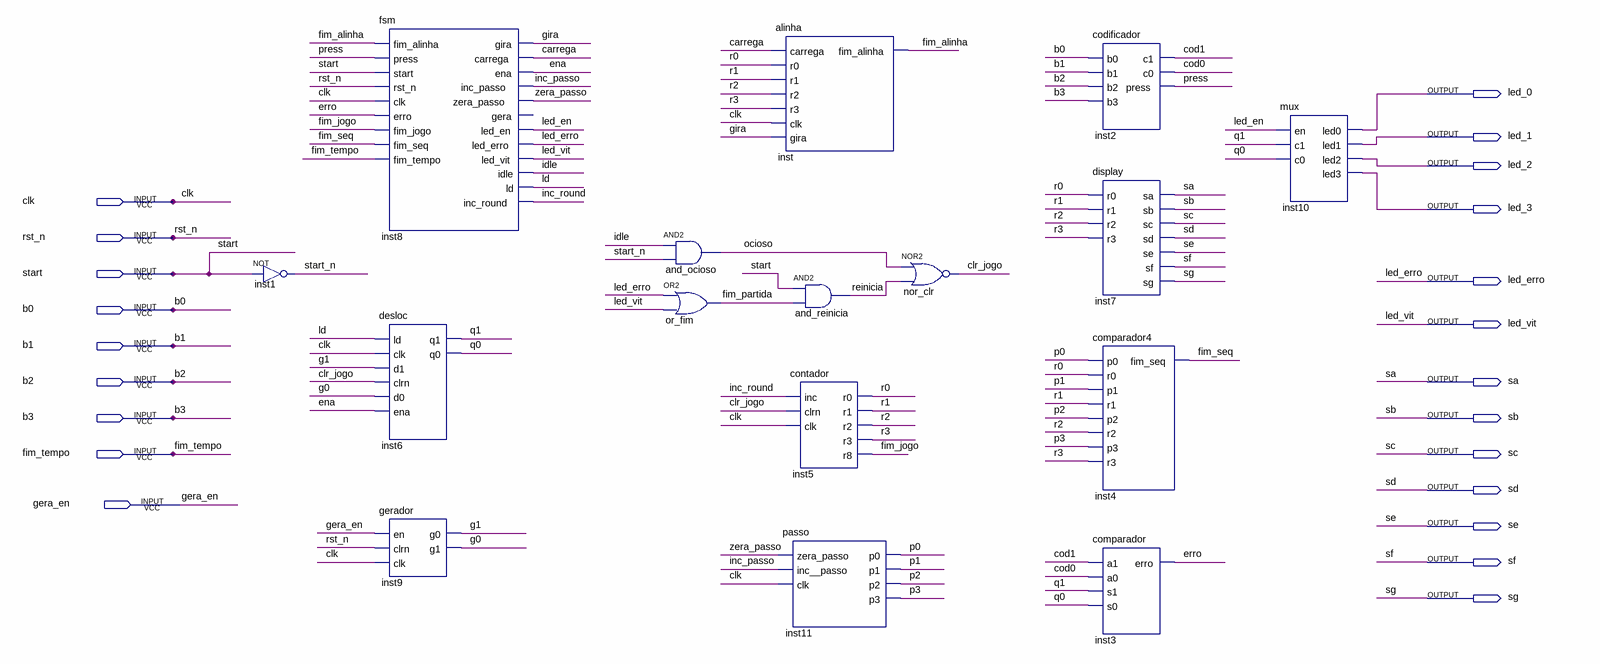
[diagram p0: schematic sheet]
// Quartus schematic genius.bdf as structural Verilog: 16 symbols, 22 pins
module genius (
  input  clk,
  input  rst_n,
  input  start,
  input  b0,
  input  b1,
  input  b2,
  input  b3,
  input  fim_tempo,
  input  gera_en,
  output led_0,
  output led_1,
  output led_2,
  output led_3,
  output led_erro,
  output led_vit,
  output sa,
  output sb,
  output sc,
  output sd,
  output se,
  output sf,
  output sg
);

  wire carrega, clr_jogo, cod0, cod1, ena, erro, fim_alinha, fim_jogo, fim_partida, fim_seq, g0, g1, gira,
       idle, inc_passo, inc_round, ld, led_en, ocioso, p0, p1, p2, p3, press, q0, q1, r0, r1, r2, r3,
       reinicia, start_n, zera_passo;

  not inst1 (start_n, start);
  fsm inst8 (
    .fim_alinha(fim_alinha), .press(press), .start(start), .rst_n(rst_n), .clk(clk), .erro(erro),
    .fim_jogo(fim_jogo), .fim_seq(fim_seq), .fim_tempo(fim_tempo), .gira(gira), .carrega(carrega), .ena(ena),
    .inc_passo(inc_passo), .zera_passo(zera_passo), .led_en(led_en), .led_erro(led_erro), .led_vit(led_vit),
    .idle(idle), .ld(ld), .inc_round(inc_round));  // open: gera
  desloc inst6 (.ld(ld), .clk(clk), .d1(g1), .clrn(clr_jogo), .d0(g0), .ena(ena), .q1(q1), .q0(q0));
  gerador inst9 (.en(gera_en), .clrn(rst_n), .clk(clk), .g0(g1), .g1(g0));
  and and_ocioso (ocioso, idle, start_n);
  or or_fim (fim_partida, led_erro, led_vit);
  alinha inst (.carrega(carrega), .r0(r0), .r1(r1), .r2(r2), .r3(r3), .clk(clk), .gira(gira), .fim_alinha(fim_alinha));
  and and_reinicia (reinicia, start, fim_partida);
  contador inst5 (.inc(inc_round), .clrn(clr_jogo), .clk(clk), .r0(r0), .r1(r1), .r2(r2), .r3(r3), .r8(fim_jogo));
  passo inst11 (.zera_passo(zera_passo), .inc__passo(inc_passo), .clk(clk), .p0(p0), .p1(p1), .p2(p2), .p3(p3));
  nor nor_clr (clr_jogo, ocioso, reinicia);
  codificador inst2 (.b0(b0), .b1(b1), .b2(b2), .b3(b3), .c1(cod1), .c0(cod0), .press(press));
  display inst7 (.r0(r0), .r1(r1), .r2(r2), .r3(r3), .sa(sa), .sb(sb), .sc(sc), .sd(sd), .se(se), .sf(sf), .sg(sg));
  comparador4 inst4 (.p0(p0), .r0(r0), .p1(p1), .r1(r1), .p2(p2), .r2(r2), .p3(p3), .r3(r3), .fim_seq(fim_seq));
  comparador inst3 (.a1(cod1), .a0(cod0), .s1(q1), .s0(q0), .erro(erro));
  mux inst10 (.en(led_en), .c1(q1), .c0(q0), .led0(led_0), .led1(led_1), .led2(led_2), .led3(led_3));
endmodule
